# EasyEDA Pro project ProPrj_小车底盘_2026-10-30.epro, board PCB1
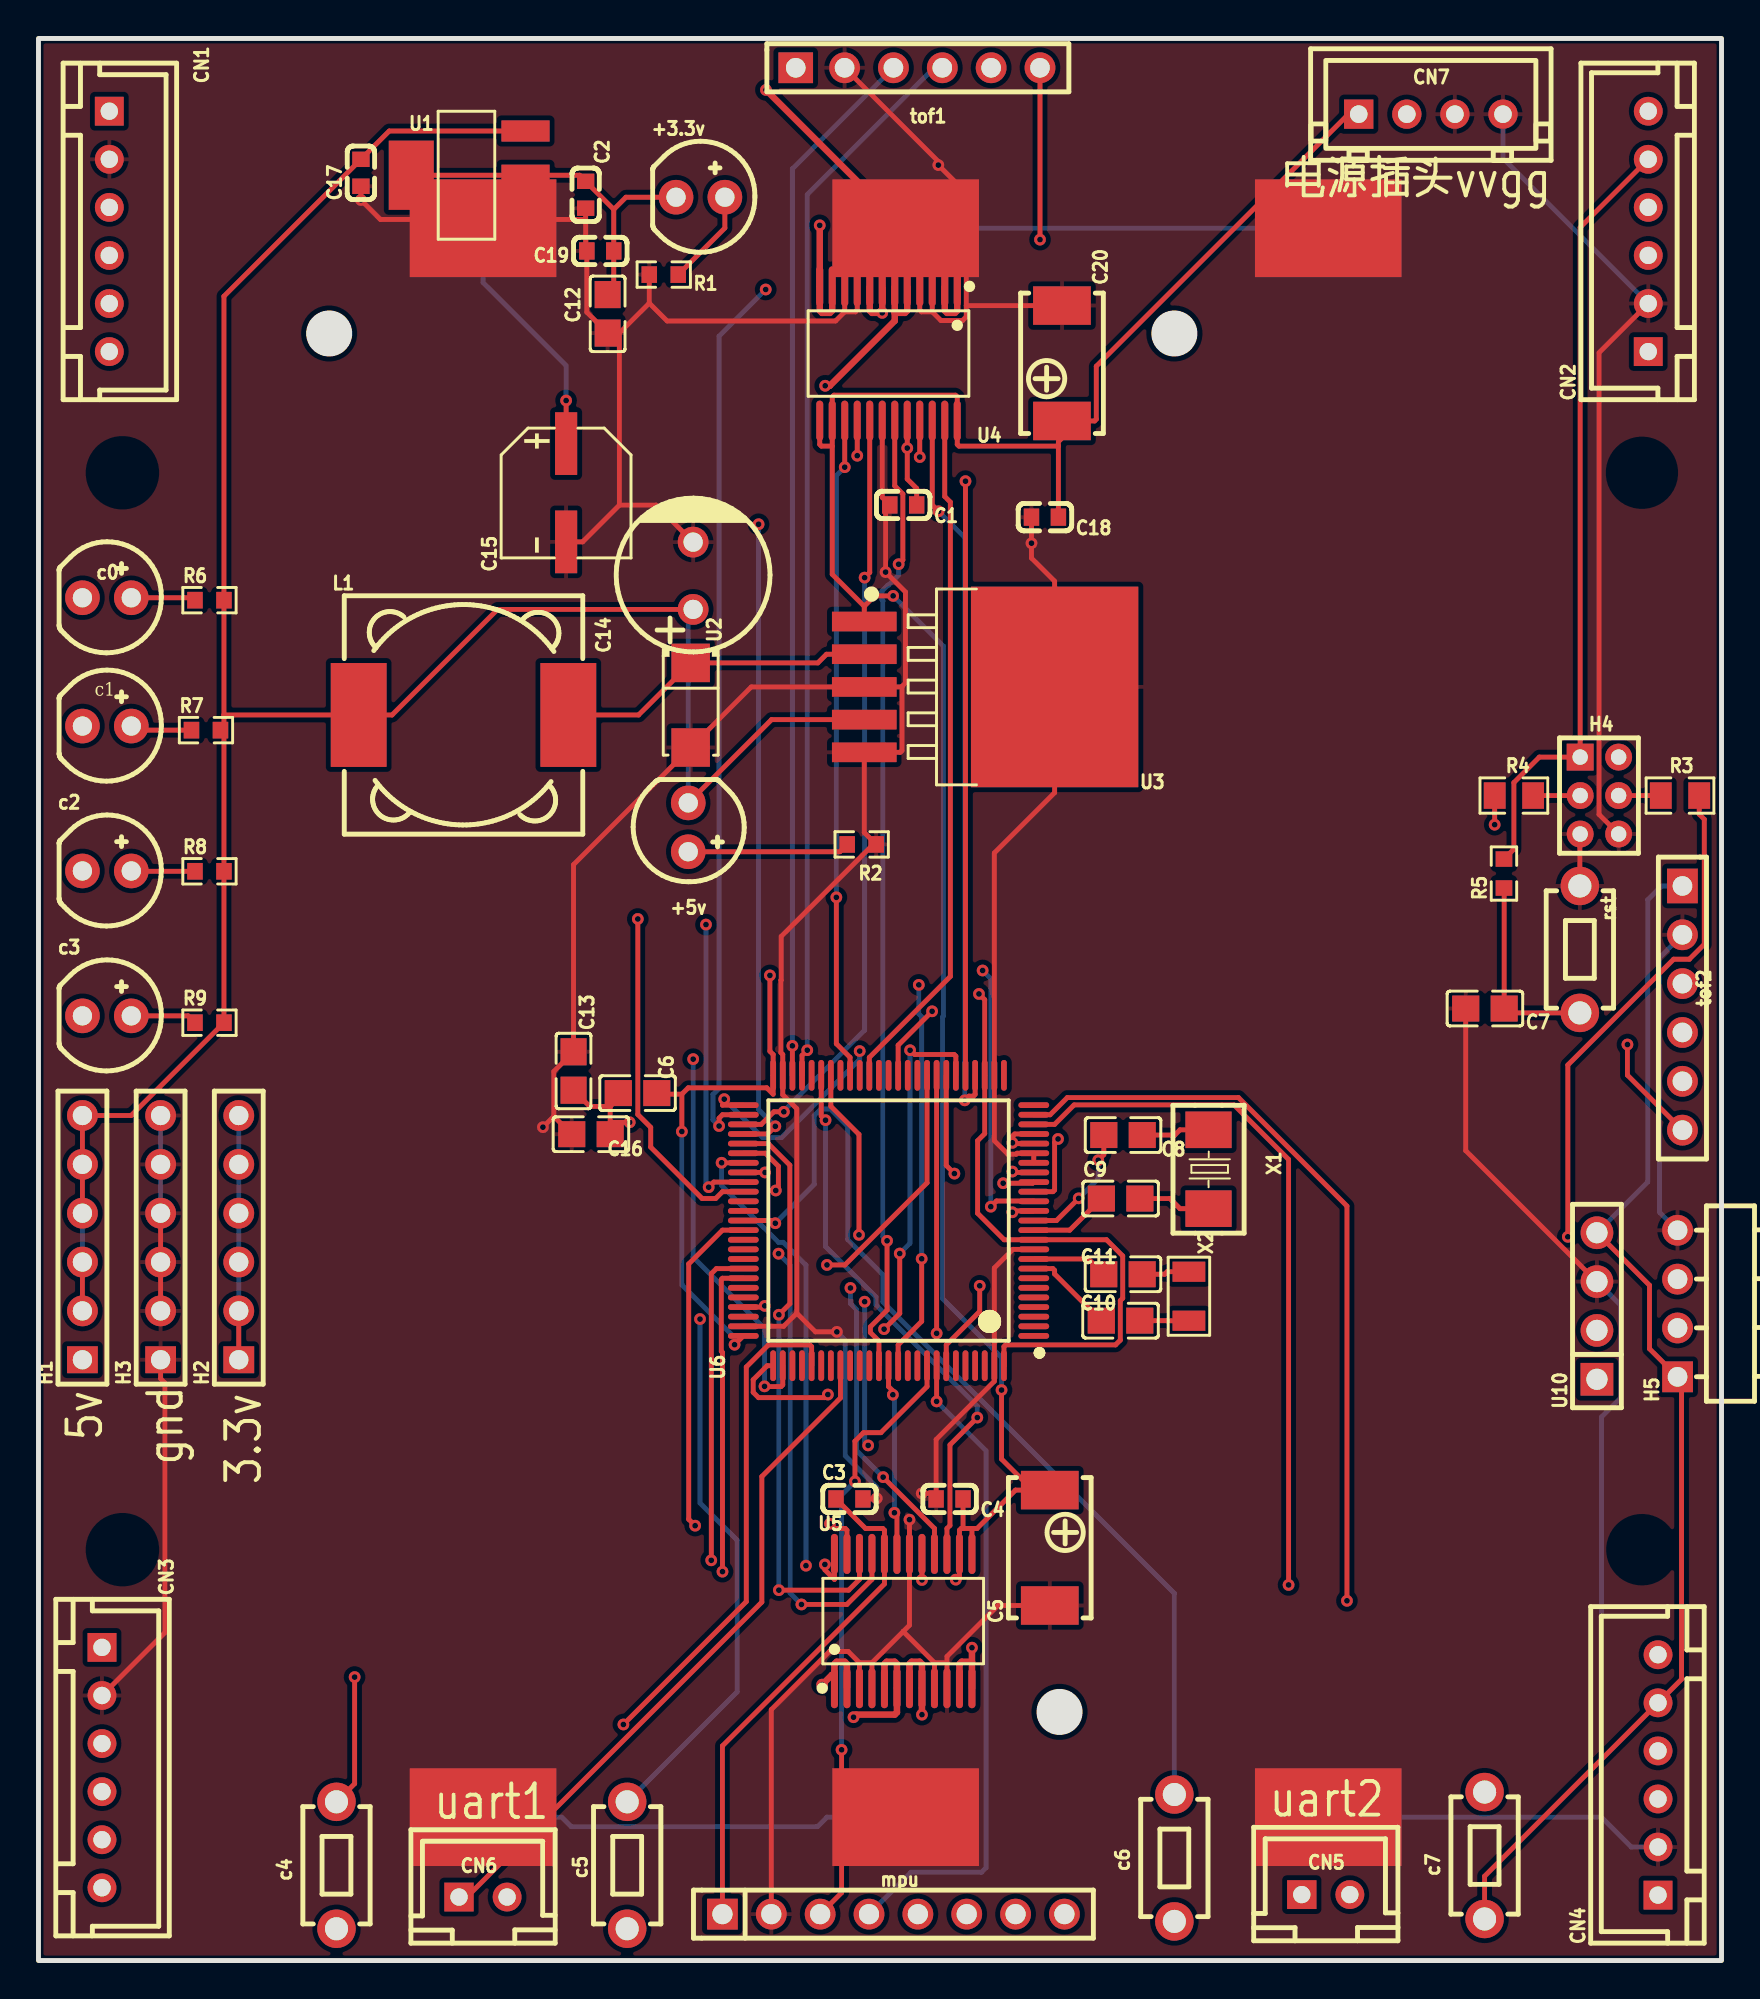
[diagram p1: board, top side]
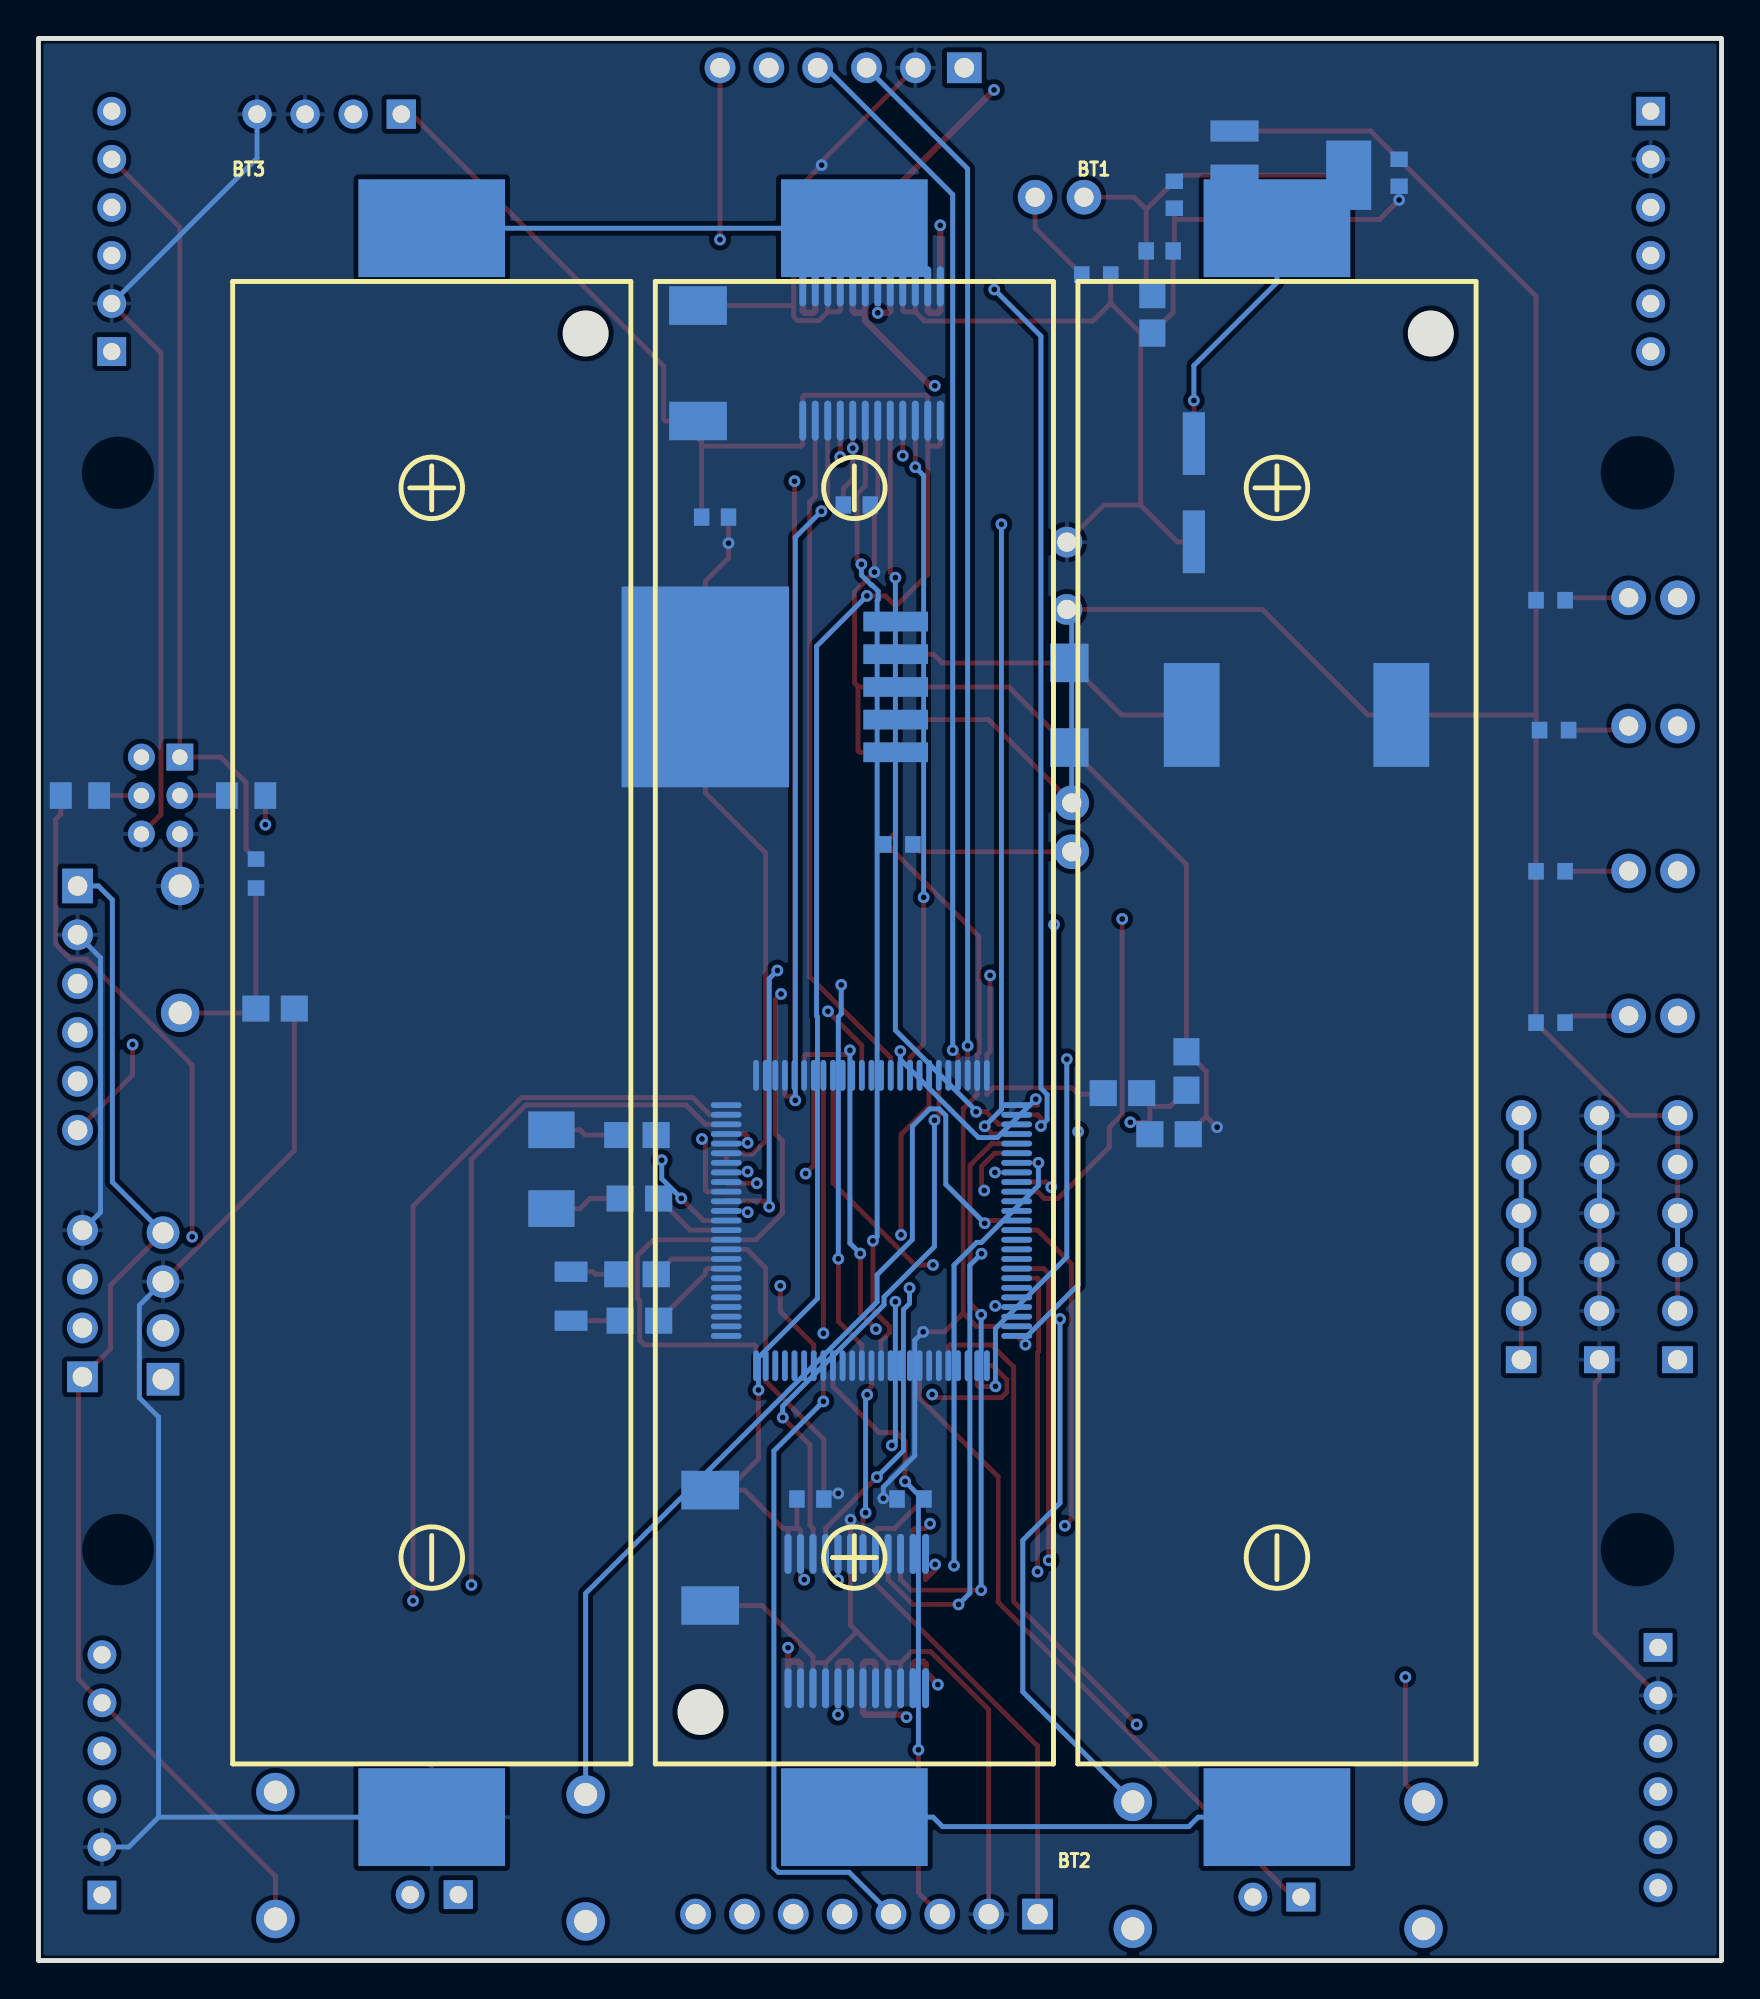
[diagram p2: board, bottom side, seen from below]

Outline 87.5 x 99.95 mm; copper layers: Top Layer, Inner1, Inner2, Bottom Layer. Coordinates in mm from the lower left corner of the outline.
Outline path: rectangle 0,99.95 87.5,0
Stack: Top Layer 0.035mm Outer layer thickness 1oz / Dielectric1 0.2104mm 7628 RC49% 8.6mil er 4.4 / Inner1 0.0152mm Inner layer thickness / Dielectric2 1.065mm 1.1mm H/HOZ Copper er 4.43 / Inner2 0.0152mm Inner layer thickness / Dielectric3 0.2104mm 7628 RC49% 8.6mil er 4.4 / Bottom Layer 0.035mm Outer layer thickness 1oz

## Design rules (mm)
spacing copperThickness1oz (default): track to track 0.102, other pairs 0.152 to 0.3
spacing copperThickness2oz: track to track 0.203, other pairs 0.152 to 0.3
track width copperThickness1oz (default): min 0.127, default 0.254, max 2.54
track width copperThickness2oz: min 0.203, default 0.254, max 2.54
track width power: min 0.2, default 0.5, max 2.54
differential pair differentialPair (default): width min 0.127, default 0.254, max 2.54; gap min 0.152, default 0.152
net GND uses copperRegion
net M1- uses power
net M1+ uses power
net M2- uses copperRegion, power
net M2+ uses power
net M3- uses power
net M3+ uses power
net M4- uses power
net M4+ uses power

## Placement (name value [footprint] x y rotation side)
+3.3v  XL-502UWC  [LED-TH_BD5.9-P2.54-RD_WHITE]  34.42 91.69 0 top
+5v  XL-502UWC  [LED-TH_BD5.9-P2.54-RD_WHITE]  33.78 58.93 270 top
BT1  BH-18650-B1BA002  [BATTERY-SMD_18650-1S-L77.1-W20.7-1]  23.11 48.77 180 bottom
BT2  BH-18650-B1BA002  [BATTERY-SMD_18650-1S-L77.1-W20.7-1]  45.08 48.77 0 bottom
BT3  BH-18650-B1BA002  [BATTERY-SMD_18650-1S-L77.1-W20.7-1]  67.06 48.77 180 bottom
c0  XL-502UWC  [LED-TH_BD5.9-P2.54-RD_WHITE]  3.56 70.87 0 top
C1  100nF  [C0603]  44.96 75.69 180 top
c1  XL-502UWC  [LED-TH_BD5.9-P2.54-RD_WHITE]  3.56 64.19 0 top
C2  22uf  [C0603]  28.45 91.82 270 top
c2  XL-502UWC  [LED-TH_BD5.9-P2.54-RD_WHITE]  3.56 56.66 0 top
C3  100nF  [C0603]  42.16 24 0 top
c3  XL-502UWC  [LED-TH_BD5.9-P2.54-RD_WHITE]  3.56 49.12 0 top
c4  TS1101DH-3x6x5.0-260  [SW-TH_L6.1-W3.5-P6.60-LS8.0]  15.49 4.95 90 top
C4  100nF  [C0603]  47.37 24 180 top
c5  TS1101DH-3x6x5.0-260  [SW-TH_L6.1-W3.5-P6.60-LS8.0]  30.61 4.95 90 top
C5  10uF  [CAP-SMD_L7.3-W4.3-RD_177EC0013]  52.58 21.46 90 top
c6  TS1101DH-3x6x5.0-260  [SW-TH_L6.1-W3.5-P6.60-LS8.0]  59.05 5.33 90 top
C6  100nF  [C0805]  31.15 45.11 0 top
c7  TS1101DH-3x6x5.0-260  [SW-TH_L6.1-W3.5-P6.60-LS8.0]  75.18 5.46 90 top
C7  100nF  [C0805]  75.2 49.5 180 top
C8  20pF  [C0805]  56.39 42.93 180 top
C9  20pF  [C0805]  56.26 39.62 0 top
C10  10pF  [C0805]  56.26 33.27 180 top
C11  10pF  [C0805]  56.38 35.69 180 top
C12  100nF  [C0805]  29.59 85.63 90 top
C13  100nF  [C0805]  27.82 46.26 270 top
C14  220uF  [CAP-TH_BD8.0-P3.50-D0.6-FD]  34.04 72.01 90 top
C15  100uF  [CAP-SMD_BD6.3-L6.6-W6.6-RD]  27.43 76.33 90 top
C16  100nF  [C0805]  28.72 42.97 0 top
C17  10uf  [C0603]  16.76 92.96 90 top
C18  100nF  [C0603]  52.33 75.06 180 top
C19  22uF  [C0603]  29.21 88.9 0 top
C20  10uF  [CAP-SMD_L7.3-W4.3-RD_177EC0013]  53.21 83.06 270 top
CN1  LAIL-PHC2.54-6P-01-XH-L  [CONN-TH_AXH-6A-11]  3.68 89.92 270 top
CN2  LAIL-PHC2.54-6P-01-XH-L  [CONN-TH_AXH-6A-11]  83.69 89.92 90 top
CN3  LAIL-PHC2.54-6P-01-XH-L  [CONN-TH_AXH-6A-11]  3.3 10.03 270 top
CN4  LAIL-PHC2.54-6P-01-XH-L  [CONN-TH_AXH-6A-11]  84.2 9.65 90 top
CN5  LAIL-PHC2.54-2P-01-XH-L  [CONN-TH_2P-P2.50_HC-XH-2A-G]  66.93 3.43 0 top
CN6  LAIL-PHC2.54-2P-01-XH-L  [CONN-TH_2P-P2.50_HC-XH-2A-G]  23.11 3.3 0 top
CN7  LAIL-PHC2.54-4P-01-XH-L  [CONN-TH_LAIL-PHC2.54-4P-01-XH-L]  72.39 96.01 0 top
H1  LAIL-PZ2.54-6P-L  [CONN-TH_LAIL-PZ2.54-6P-L]  2.29 37.59 90 top
H2  LAIL-PZ2.54-6P-L  [CONN-TH_LAIL-PZ2.54-6P-L]  10.41 37.59 90 top
H3  LAIL-PZ2.54-6P-L  [CONN-TH_LAIL-PZ2.54-6P-L]  6.35 37.59 90 top
H4  LAIL-PZ2.0-3PX2-L  [CONN-TH_LAIL-PZ2.0-3PX2-L]  81.15 60.58 270 top
H5  LAIL-PZ2.54-4P-W  [HDR-TH_LAIL-PZ2.54-4P-W]  85.22 34.16 90 top
L1  47uH  [IND-SMD_L12.3-W12.3]  22.1 64.77 0 top
mpu  LAIL-PM2.54-8P-L  [HDR-TH_LAIL-PM2.54-8P-L]  44.45 2.41 0 top
R1  30K  [R0603]  32.51 87.67 180 top
R2  30K  [R0603]  42.8 58.04 0 top
R3  10kΩ  [R0805]  85.34 60.58 0 top
R4  10kΩ  [R0805]  76.71 60.58 0 top
R5  10kΩ  [R0603]  76.19 56.52 90 top
R6  10K  [R0603]  8.89 70.74 0 top
R7  10K  [R0603]  8.71 63.98 0 top
R8  10K  [R0603]  8.89 56.64 0 top
R9  10K  [R0603]  8.89 48.77 0 top
rst  TS1101DH-3x6x5.0-260  [SW-TH_L6.1-W3.5-P6.60-LS8.0]  80.14 52.58 270 top
tof1  LAIL-PM2.54-6P-L  [HDR-TH_LAIL-PM2.54-6P-L]  45.72 98.43 0 top
tof2  LAIL-PM2.54-6P-L  [HDR-TH_LAIL-PM2.54-6P-L]  85.47 49.53 270 top
U1  AMS1117-3.3  [SOT-223-3_L6.5-W3.4-P2.30-LS7.0-BR]  22.35 92.84 0 top
U2  1N5822D_SMA  [SMA_L4.3-W2.6-LS5.2-RD]  33.91 65.28 270 top
U3  LM2596S-5.0/TR  [TO-263-5_L10.1-W8.7-P1.70-LS14.4-BR]  47.88 66.23 180 top
U4  TB6612FNG(O,C,8,EL  [SSOP-24_L8.4-W5.8-P0.65-LS7.8-BL]  44.19 83.57 180 top
U5  TB6612FNG(O,C,8,EL  [SSOP-24_L8.4-W5.8-P0.65-LS7.8-BL]  44.96 17.65 0 top
U6  STM32F103VET6  [LQFP-100_L14.0-W14.0-P0.50-LS16.0-BL]  44.2 38.48 90 top
U10  LAIL-PM2.54-4P-L  [HDR-TH_4P-P2.54-V-F]  81.03 34.04 90 top
X1  8MHz  [CRYSTAL-SMD_L5.0-W3.2]  60.83 41.15 90 top
X2  32.768kHz  [CRYSTAL-SMD_L3.2-W1.5-1]  59.81 34.54 270 top

## Footprints (pads in the part's own frame, mm; a bottom-side part is the same pattern mirrored in y, then rotated)
BATTERY-SMD_18650-1S-L77.1-W20.7-1
  rect 7.62x5.08 hole 0.001: 1(0,-41.313) 2(0,41.313)
C0603
  rect 0.8x0.9 hole 0.001: 1(-0.7,0) 2(0.7,0)
C0805
  rect 1.41x1.35 hole 0.001: 1(-1,0) 2(1,0)
CAP-SMD_BD6.3-L6.6-W6.6-RD
  rect 3.26x1.15 hole 0.001: 1(2.555,0) 2(-2.555,0)
CAP-SMD_L7.3-W4.3-RD_177EC0013
  rect 2x3 hole 0.001: 1(-3,0) 2(3,0)
CAP-TH_BD8.0-P3.50-D0.6-FD
  round 1.6 hole 1: 1(-1.75,0) 2(1.75,0)
CONN-TH_2P-P2.50_HC-XH-2A-G
  rect 1.524x1.5 hole 0.9: 1(-1.25,0)
  round 1.5 hole 0.9: 2(1.25,0)
CONN-TH_AXH-6A-11
  rect 1.5x1.5 hole 0.9: 1(-6.25,0)
  round 1.5 hole 0.9: 2(-3.75,0) 3(-1.25,0) 4(1.25,0) 5(3.75,0) 6(6.25,0)
CONN-TH_LAIL-PHC2.54-4P-01-XH-L
  rect 1.524x1.524 hole 0.914: 1(-3.75,0)
  round 1.524 hole 0.914: 2(-1.25,0) 3(1.25,0) 4(3.75,0)
CONN-TH_LAIL-PZ2.0-3PX2-L
  rect 1.4x1.4 hole 0.8: 1(-2,-1)
  round 1.4 hole 0.8: 2(-2,1) 3(0,-1) 4(0,1) 5(2,-1) 6(2,1)
CONN-TH_LAIL-PZ2.54-6P-L
  rect 1.4x1.6 hole 1: 1(-6.35,0)
  round 1.6 hole 1: 2(-3.81,0) 3(-1.27,0) 4(1.27,0) 5(3.81,0) 6(6.35,0)
CRYSTAL-SMD_L3.2-W1.5-1
  rect 1.05x1.7 hole 0.001: 1(-1.275,0) 2(1.275,0)
CRYSTAL-SMD_L5.0-W3.2
  rect 1.9x2.4 hole 0.001: 1(-2.05,0) 2(2.05,0)
HDR-TH_4P-P2.54-V-F
  rect 1.7x1.7 hole 1.1: 1(-3.81,0)
  round 1.7 hole 1.1: 2(-1.27,0) 3(1.27,0) 4(3.81,0)
HDR-TH_LAIL-PM2.54-6P-L
  rect 1.8x1.6 hole 1.02: 1(-6.35,0)
  round 1.6 hole 1.02: 2(-3.81,0) 3(-1.27,0) 4(1.27,0) 5(3.81,0) 6(6.35,0)
HDR-TH_LAIL-PM2.54-8P-L
  rect 1.6x1.6 hole 1.05: 1(-8.89,0)
  round 1.6 hole 1.05: 2(-6.35,0) 3(-3.81,0) 4(-1.27,0) 5(1.27,0) 6(3.81,0) 7(6.35,0) 8(8.89,0)
HDR-TH_LAIL-PZ2.54-4P-W
  rect 1.6x1.6 hole 1.02: 1(-3.81,0)
  round 1.6 hole 1.02: 2(-1.27,0) 3(1.27,0) 4(3.81,0)
IND-SMD_L12.3-W12.3
  rect 2.9x5.4 hole 0.001: 1(-5.45,0) 2(5.45,0)
LED-TH_BD5.9-P2.54-RD_WHITE
  round 1.8 hole 1: 1(-1.27,0) 2(1.27,0)
LQFP-100_L14.0-W14.0-P0.50-LS16.0-BL
  oval 0.3x1.6 hole 0.001: 1(-6,-7.55) 2(-5.5,-7.55) 3(-5,-7.55) 4(-4.5,-7.55) 5(-4,-7.55) 6(-3.5,-7.55) 7(-3,-7.55) 8(-2.5,-7.55) 9(-2,-7.55) 10(-1.5,-7.55) 11(-1,-7.55) 12(-0.5,-7.55) 13(0,-7.55) 14(0.5,-7.55) 15(1,-7.55) 16(1.5,-7.55) 17(2,-7.55) 18(2.5,-7.55) 19(3,-7.55) 20(3.5,-7.55) 21(4,-7.55) 22(4.5,-7.55) 23(5,-7.55) 24(5.5,-7.55) 25(6,-7.55) 51(6,7.55) 52(5.5,7.55) 53(5,7.55) 54(4.5,7.55) 55(4,7.55) 56(3.5,7.55) 57(3,7.55) 58(2.5,7.55) 59(2,7.55) 60(1.5,7.55) 61(1,7.55) 62(0.5,7.55) 63(0,7.55) 64(-0.5,7.55) 65(-1,7.55) 66(-1.5,7.55) 67(-2,7.55) 68(-2.5,7.55) 69(-3,7.55) 70(-3.5,7.55) 71(-4,7.55) 72(-4.5,7.55) 73(-5,7.55) 74(-5.5,7.55) 75(-6,7.55)
  oval 1.6x0.3 hole 0.001: 26(7.55,-6) 27(7.55,-5.5) 28(7.55,-5) 29(7.55,-4.5) 30(7.55,-4) 31(7.55,-3.5) 32(7.55,-3) 33(7.55,-2.5) 34(7.55,-2) 35(7.55,-1.5) 36(7.55,-1) 37(7.55,-0.5) 38(7.55,0) 39(7.55,0.5) 40(7.55,1) 41(7.55,1.5) 42(7.55,2) 43(7.55,2.5) 44(7.55,3) 45(7.55,3.5) 46(7.55,4) 47(7.55,4.5) 48(7.55,5) 49(7.55,5.5) 50(7.55,6) 76(-7.55,6) 77(-7.55,5.5) 78(-7.55,5) 79(-7.55,4.5) 80(-7.55,4) 81(-7.55,3.5) 82(-7.55,3) 83(-7.55,2.5) 84(-7.55,2) 85(-7.55,1.5) 86(-7.55,1) 87(-7.55,0.5) 88(-7.55,0) 89(-7.55,-0.5) 90(-7.55,-1) 91(-7.55,-1.5) 92(-7.55,-2) 93(-7.55,-2.5) 94(-7.55,-3) 95(-7.55,-3.5) 96(-7.55,-4) 97(-7.55,-4.5) 98(-7.55,-5) 99(-7.55,-5.5) 100(-7.55,-6)
R0603
  rect 0.806x0.864 hole 0.001: 1(-0.753,0) 2(0.753,0)
R0805
  rect 1.133x1.377 hole 0.001: 1(-1,0) 2(1,0)
SMA_L4.3-W2.6-LS5.2-RD
  rect 2x2 hole 0.001: 1(-2.2,0) 2(2.2,0)
SOT-223-3_L6.5-W3.4-P2.30-LS7.0-BR
  rect 2.5x1.1 hole 0.001: 1(2.97,-2.3) 2(2.97,0) 3(2.97,2.3)
  rect 2.34x3.6 hole 0.001: 4(-2.97,0)
SSOP-24_L8.4-W5.8-P0.65-LS7.8-BL
  oval 0.364x2.082 hole 0.001: 1(-3.575,-3.491) 2(-2.925,-3.491) 3(-2.275,-3.491) 4(-1.625,-3.491) 5(-0.975,-3.491) 6(-0.325,-3.491) 7(0.325,-3.491) 8(0.975,-3.491) 9(1.625,-3.491) 10(2.275,-3.491) 11(2.925,-3.491) 12(3.575,-3.491) 13(3.575,3.491) 14(2.925,3.491) 15(2.275,3.491) 16(1.625,3.491) 17(0.975,3.491) 18(0.325,3.491) 19(-0.325,3.491) 20(-0.975,3.491) 21(-1.625,3.491) 22(-2.275,3.491) 23(-2.925,3.491) 24(-3.575,3.491)
SW-TH_L6.1-W3.5-P6.60-LS8.0
  round 2 hole 1.2: 1(-3.3,0) 2(3.3,0)
TO-263-5_L10.1-W8.7-P1.70-LS14.4-BR
  rect 3.358x1.02 hole 0.001: 1(4.949,-3.4) 2(4.949,-1.7) 3(4.949,0) 4(4.949,1.7) 5(4.949,3.4)
  rect 8.7x10.431 hole 0.001: 6(-4.949,0)

## Nets
As in the schematic, except:
GND: BT3.1 C1.2 C2.2 C3.2 C4.2 C5.1 C7.2 C12.1 C13.1 C14.2 C15.2 C16.1 C17.1 C18.2 C19.1 C20.1 CN1.2 CN2.2 CN3.2 CN4.2 CN7.3 CN7.4 H3.1 H3.2 H3.3 H3.4 H3.5 H3.6 H4.5 H4.6 H5.4 mpu.2 R1.2 R2.2 rst.1 tof1.2 tof2.2 U1.1 U2.2 U3.3 U3.5 U3.6 U4.3 U4.4 U4.9 U4.10 U4.18 U5.3 U5.4 U5.9 U5.10 U5.18 U6.10 U6.19 U6.20 U6.27 U6.49 U6.74 U6.99 U10.3
VCC: BT1.2 C4.1 C5.2 C15.1 C18.1 C20.2 CN7.1 CN7.2 U3.1 U4.13 U4.14 U4.24 U5.13 U5.14 U5.24

Pads without a net: mpu 5 6 8; tof1 5; tof2 5; U6 1 2 3 4 5 7 25 26 35 36 38 39 41 43 46 61 62 65 66 67 70 71 73 78 79 81 82 84 85 86 90 91 95 96 97 98

## Via types
v1: diameter 0.61, hole 0.305, Top Layer to Bottom Layer, 108 vias

## Routing (per net, layer and track width the routed paths; a pad name or vN(x,y) marks a point on that pad's centre or on a via; arc(x,y) is an arc through that point)
+3.3V: length 450.8
  Top Layer w0.254: +3.3v.1 30.55,91.69 29.91,91.06 ; C13.2 28.66,44.41 29.72,44.41 ; 29.72,44.41 29.72,43.59 ; 29.72,44.41 30.15,44.84 30.15,45.11 ; 29.72,43.59 C16.2 ; 29.72,43.59 v1(30.74,43.59) ; 50.66,42.52 50.7,42.48 U6.21 ; 50.66,42.52 v1(50.64,42.52) ; 50.66,42.52 50.66,42.89 50.75,42.98 U6.22 ; 29.91,91.06 C2.1 28.13,92.84 U1.2 U1.4 ; 29.91,91.06 C19.2 29.91,86.95 C12.2 ; c7.1 75.18,4.39 CN4.5 85.42,14.63 85.42,30.15 H5.1 83.76,31.81 83.76,35.11 81.03,37.85 ; mpu.1 35.56,11.16 43.98,19.58 U5.20 43.98,22.38 43.89,22.47 43,22.47 C3.1 ; H2.1 H2.2 ; R5.2 76.71,57.79 76.71,61.26 78.03,62.58 H4.1 80.15,90.13 CN2.5 ; U4.20 v1(45.17,78.65) 45.17,77.04 45.66,76.55 C1.1
  Inner2 w0.254: 48.73,39.43 49.1,39.79 50.4,39.79 51.33,40.72 51.33,41.83 v1(50.64,42.52) ; 48.73,39.43 40.32,39.43 35.76,43.98 31.13,43.98 v1(30.74,43.59) 30.39,43.94 H2.6 ; 48.73,39.43 48.73,39.15 49.66,38.22 80.65,38.22 81.03,37.85 ; CN2.5 84.85,94.82 84.85,96.51 84.02,97.34 39.37,97.34 ; H4.1 H4.2 85.47,59.26 tof2.1 ; CN3.5 2.2,5.18 2.2,3.31 3.86,1.65 c4.1 c5.1 31.37,2.41 mpu.1 36.71,1.27 49.65,1.27 mpu.7 52.03,1.18 58.2,1.18 c6.1 75.06,2.03 c7.1 ; 39.37,97.34 38.79,97.34 +3.3v.1 33.15,90.48 ; 39.37,97.34 tof1.1 ; 33.15,90.48 7.99,90.48 CN1.5 ; 33.15,90.48 33.34,90.48 v1(45.17,78.65)
  Bottom Layer w0.254: H2.6 H2.5 H2.4 H2.2 ; 81.03,37.85 83.66,40.48 83.66,55.16 84.39,55.88 tof2.1
+5V: length 127
  Top Layer w0.254: +5v.1 38.11,64.53 U3.4 ; 9.64,64.77 9.64,64.16 9.46,63.98 9.64,63.8 R8.2 R9.2 4.82,43.94 H1.6 H1.5 H1.4 ; 9.64,64.77 R6.2 9.64,86.54 C17.2 18.24,95.14 U1.3 ; 9.64,64.77 L1.1 18.38,64.77 23.87,70.26 C14.1 ; H1.2 2.29,36.32
  Inner2 w0.254: H1.1 H1.2
  Bottom Layer w0.254: C14.1 33.78,70.01 +5v.1 ; H1.4 2.29,36.32
GND: length 543.4
  Top Layer w0.254: v1(45.28,22.93) U5.18 45.28,17.44 44.96,17.11 ; tof1.2 46.78,93.55 v1(46.78,93.36) 48.24,91.91 48.24,86.06 ; C16.1 26.79,43.9 ; 26.79,43.9 26.79,46.23 C13.1 27.82,56.99 U2.2 37.06,66.23 U3.3 44.87,66.23 ; 26.79,43.9 v1(26.23,43.34) ; CN3.2 6.57,17.06 6.57,30.03 6.35,30.26 H3.1 ; 28.45,90.54 U1.1 17.78,90.54 v1(16.76,91.55) C17.1 ; 28.45,90.54 C2.2 ; 28.45,90.54 28.45,88.96 C19.1 28.51,85.71 C12.1 30.2,84.63 ; C5.1 49.89,18.46 47.23,15.81 47.23,15.49 ; 30.2,84.63 30.2,75.68 ; 30.2,84.63 31.76,86.19 ; 30.2,75.68 32.11,75.68 C14.2 ; 30.2,75.68 28.29,73.77 C15.2 ; 42.68,15.49 42.1,16.07 41.13,16.07 38.1,13.05 mpu.2 ; 42.68,15.49 43.33,15.49 ; 42.68,15.49 U5.3 ; 43.33,15.49 44.96,17.11 ; 43.33,15.49 U5.4 ; 44.96,17.11 46.58,15.49 ; C3.2 43.55,24 v1(43.58,24.04) ; H3.2 H3.4 ; H4.5 80.14,58.56 rst.1 ; 39.42,33.66 38.74,32.98 U6.74 ; 39.42,33.66 40.4,32.69 v1(41.51,32.69) ; 39.42,33.66 39.42,44.3 38.7,45.03 U6.49 38.7,47.11 38.6,47.21 38.6,50.97 38.62,50.98 38.62,53.25 43.4,58.04 R2.2 42.93,58.66 U3.5 44.81,62.83 44.9,62.92 44.9,66.2 44.87,66.23 ; 41.92,85.73 U4.10 41.92,88.29 42.01,88.38 45.73,88.38 45.82,88.29 U4.4 45.82,85.82 45.91,85.73 46.47,85.73 ; 41.92,85.73 41.44,85.26 32.68,85.26 31.76,86.19 ; 41.92,85.73 42.48,85.73 42.57,85.82 U4.9 ; 31.76,86.19 R1.2 ; 44.87,66.23 45.08,66.44 45.08,71.17 v1(44.04,72.2) 44.04,75.48 C1.2 43.87,76.08 U4.18 ; U5.9 46.58,15.49 ; 46.58,15.49 47.23,15.49 ; U6.19 U6.20 50.88,41.98 50.83,41.93 50.39,41.93 49.7,42.63 U6.27 49.7,57.6 52.83,60.73 U3.6 52.83,71.73 51.63,72.93 v1(51.63,73.7) C18.2 ; 48.24,86.06 C20.1 ; 48.24,86.06 48.24,85.48 48.04,85.28 46.92,85.28 46.47,85.73 ; 46.47,85.73 U4.3 ; v1(45.92,24.29) 46.38,24.29 C4.2 46.67,27.1 49.7,30.12 U6.99 49.7,36.01 50.66,36.98 U6.10 ; U5.10 47.23,15.49 ; C7.2 74.2,42.11 81.01,35.31 U10.3 ; CN2.2 81.13,83.61 81.13,59.6 H4.6
  Inner2 w0.254: tof2.2 82.67,53.34 rst.1 ; H4.6 H4.5 ; 44.04,73.7 43.99,73.76 C14.2 ; 44.04,73.7 v1(44.04,72.2) ; 44.04,73.7 v1(51.63,73.7) ; v1(26.23,43.34) 25.7,42.81 7.49,42.81 H3.6 ; 45.28,24.04 45.67,24.04 v1(45.92,24.29) ; 45.28,24.04 v1(43.58,24.04) ; 45.28,24.04 v1(45.28,22.93) ; v1(46.78,93.36) 70.99,93.36 CN7.3 CN7.4 ; U10.3 83.69,37.97 H5.4 ; H3.1 H3.2 ; v1(16.76,91.55) 14.65,93.67 CN1.2
  Bottom Layer w0.254: v1(43.58,24.04) 43.58,24.62 41.94,26.25 41.94,32.26 v1(41.51,32.69) ; U10.3 82.26,34.07 82.26,29.26 81.26,28.26 81.26,7.46 ; CN2.2 76.14,93.72 CN7.4 ; BT3.1 81.26,7.46 ; 81.26,7.46 82.81,5.9 CN4.2 ; H5.4 84.28,38.91 84.28,52.15 tof2.2 ; H3.6 H3.5 H3.4
VCC: length 167.6
  Top Layer w0.254: C20.2 54.11,80.06 ; 54.11,80.06 53.03,78.98 53.03,78.75 ; 54.11,80.06 54.91,80.06 55,80.15 55,82.9 68.11,96.01 CN7.1 ; 53.03,78.75 47.86,78.75 47.77,78.84 U4.24 47.77,81.31 47.68,81.4 41.36,81.4 41.27,81.31 U4.14 41.27,78.75 ; 53.03,78.75 C18.1 ; U4.13 40.62,78.84 40.71,78.75 41.27,78.75 ; U5.24 41.38,19.82 40.89,20.32 v1(40.89,20.6) ; 42.93,70.42 43.47,70.96 v1(44.43,70.96) ; 42.93,70.42 U3.1 ; 42.93,70.42 41.27,72.09 41.27,78.75 ; U5.13 48.53,22.47 ; 48.53,22.47 48.07,22.47 ; 48.53,22.47 48.8,22.47 50.8,24.46 51.69,24.46 ; C5.2 51.69,24.46 ; 51.69,24.46 50.07,26.08 v1(50.07,29.67) ; 48.07,22.47 C4.1 ; 48.07,22.47 47.97,22.47 47.88,22.38 U5.14 47.88,19.91 47.79,19.82 47.7,19.82 v1(47.69,19.81) ; v1(27.43,81.12) 27.43,78.88
  Inner2 w0.254: v1(40.89,20.6) 46.9,20.6 v1(47.69,19.81) ; CN7.1 CN7.2 ; v1(44.43,70.96) 35.3,70.96 27.43,78.83 v1(27.43,81.12)
  Bottom Layer w0.254: v1(50.07,29.67) 50.07,31.36 47,34.43 47,49.07 47.05,49.12 47.05,68.35 v1(44.43,70.96) ; v1(27.43,81.12) 27.43,82.94 23.11,87.26 BT1.2
A1: length 65.8
  Top Layer w0.254: v1(34.84,40.22) 35.11,40.48 U6.59
  Inner2 w0.254: v1(34.7,53.87) 30.96,57.61 28.2,57.61 2.57,83.25 2.57,87.55 CN1.4
  Bottom Layer w0.254: v1(34.84,40.22) 34.7,40.36 v1(34.7,53.87)
A2: length 115.9
  Top Layer w0.254: v1(37.75,29.86) 37.76,29.85 38.61,29.85 38.7,29.94 U6.77
  Inner2 w0.254: CN2.4 85.12,89.73 85.12,82.59 53.43,50.89 47.46,50.89 46.18,52.17 38.14,52.17 37.44,51.47 37.44,50.99 37.78,50.64 38.27,50.64 39.08,51.45 45.88,51.45 46.43,50.91 46.43,50.43 45.95,49.95 38.6,49.95 35.52,46.87 v1(34.04,46.87)
  Bottom Layer w0.254: v1(37.75,29.86) 37.75,32.87 34.04,36.58 v1(34.04,46.87)
A3: length 69.7
  Top Layer w0.254: v1(44.78,36.76) 44.78,33.65 v1(43.96,32.83) ; U6.31 47.7,47.02 47.61,47.11 45.56,47.11 45.31,47.36 v1(45.31,47.34)
  Inner2 w0.254: v1(43.96,32.83) 43.23,32.1 39.48,32.1 38.96,32.62 27.14,32.62 CN3.4
  Bottom Layer w0.254: v1(44.78,36.76) 45.31,37.3 v1(45.31,47.34)
A4: length 59.7
  Top Layer w0.254: U6.23 52.83,43.48 53.84,44.49 62.16,44.49 64.99,41.66 v1(64.99,19.53)
  Inner2 w0.254: v1(64.99,19.53) 75.57,19.53 CN4.4
B1: length 67.9
  Top Layer w0.254: U6.60 35.56,39.98 35.21,39.63 34.5,39.63 31.83,42.3 31.83,43.33 31.16,44 v1(31.16,54.16)
  Inner2 w0.254: v1(31.16,54.16) 30.96,54.16 2.21,82.92 2.21,89.69 CN1.3
B2: length 185.4
  Top Layer w0.254: U6.89 44.7,32.01 45.92,33.24 v1(45.92,36.49)
  Inner2 w0.254: v1(45.77,50.73) 38.87,50.73 38.42,50.28 21.06,50.28 1.1,70.23 1.1,71.36 1.8,72.05 2.78,72.05 3.47,71.36 3.47,70.54 20.77,53.24 55.23,53.24 84.72,82.73 84.72,87.63 CN2.3
  Bottom Layer w0.254: v1(45.77,50.73) 45.77,49.22 45.92,49.07 v1(45.92,36.49)
B3: length 84.9
  Top Layer w0.254: U6.32 47.2,41.34 v1(47.62,40.92)
  Inner2 w0.254: CN3.3 6.46,14.45 6.46,24.8 5.27,26 5.27,44.52 5.77,45.03 35.05,45.03 35.41,45.38 35.9,45.38 36.25,45.03 43.51,45.03 v1(47.62,40.92)
B4: length 60
  Top Layer w0.254: U6.24 52.6,43.98 53.49,44.88 62.39,44.88 68.03,39.23 v1(68.03,18.71)
  Inner2 w0.254: CN4.3 73.9,18.71 v1(68.03,18.71)
BOOT0: length 63
  Top Layer w0.254: U6.94 47.2,32.01 48.94,33.75 v1(48.94,35.09) ; v1(79.51,37.63) 79.51,46.57 85.01,52.07 85.83,52.07 86.61,52.85 86.61,59.34 86.34,59.61 R3.2
  Inner2 w0.254: v1(48.94,35.09) 76.97,35.09 v1(79.51,37.63)
BOOT1: length 38.8
  Top Layer w0.254: v1(46.46,49.36) 44.7,47.6 U6.37 ; v1(75.71,59.07) R4.1
  Inner2 w0.254: v1(75.71,59.07) 63.6,59.07 53.89,49.36 v1(46.46,49.36)
C0: length 69.6
  Top Layer w0.254: U6.15 51.73,39.5 49.81,39.5 v1(49.51,39.2)
  Inner2 w0.254: v1(49.09,51.48) 48.04,52.53 20.62,52.53 c0.1
  Bottom Layer w0.254: v1(49.09,51.48) 49.51,51.06 v1(49.51,39.2)
C1: length 63.6
  Top Layer w0.254: v1(53.01,42.72) 52.83,42.54 52.83,40.07 52.74,39.98 U6.16
  Inner2 w0.254: v1(53.01,42.72) 49.45,46.28 36.53,46.28 36.34,46.46 34.96,46.46 34.78,46.28 20.2,46.28 c1.1
C2: length 63
  Top Layer w0.254: U6.17 51.69,40.42 v1(50.15,40.42)
  Inner2 w0.254: c2.1 0.99,55.36 0.99,48.69 4.29,45.39 34.91,45.39 35.26,45.74 36.05,45.74 36.4,45.39 45.19,45.39 v1(50.15,40.42)
C3: length 53.1
  Top Layer w0.254: U6.18 50.68,40.98 v1(50.63,41.03)
  Inner2 w0.254: c3.1 5.66,45.75 34.76,45.75 35.11,46.1 36.2,46.1 36.55,45.75 45.91,45.75 v1(50.63,41.03)
C4: length 58
  Top Layer w0.254: c4.2 16.44,9.2 v1(16.44,14.74) ; U6.33 v1(46.7,32.62)
  Inner2 w0.254: v1(46.7,32.62) 45.38,31.3 40.8,31.3 24.24,14.74 v1(16.44,14.74)
C5: length 48.6
  Top Layer w0.254: U6.34 46.2,40.44 41.93,36.17 v1(40.99,36.17)
  Inner2 w0.254: v1(40.99,36.17) 37.21,36.17 v1(34.39,33.36)
  Bottom Layer w0.254: c5.2 36.33,13.97 36.33,21.86 34.39,23.79 v1(34.39,33.36)
C6: length 52.2
  Top Layer w0.254: U6.63 38.17,38.48 v1(38.31,38.34)
  Bottom Layer w0.254: c6.2 59.05,19.09 43.9,34.25 43.9,35.66 42.07,37.49 42.07,43.38 41.16,44.29 40.68,44.29 40.33,43.94 40.33,40.36 v1(38.31,38.34)
C7: length 64.8
  Top Layer w0.254: v1(34.14,22.61) 33.81,22.95 33.81,36.22 35.56,37.98 U6.64
  Inner2 w0.254: c7.2 73.48,10.47 47.31,10.47 40.26,17.52 40.26,18.76 36.4,22.61 v1(34.14,22.61)
CLK: length 51.7
  Top Layer w0.254: v1(41.04,29.43) 40.88,29.27 37.44,29.27 37.16,29.55 37.16,30.2 37.89,30.93 U6.76
  Inner2 w0.254: H5.2 83.75,31.42 50.11,31.42 48.7,30.01 41.62,30.01 v1(41.04,29.43)
M1: length 35.9
  Top Layer w0.254: U4.23 47.12,76.13 47.41,75.84 47.41,51.17 43.2,46.96 U6.40
M1+: length 52.8
  Top Layer w0.336: U4.2 47.12,85.8 47.24,85.68 47.65,85.68 47.77,85.8 U4.1 47.77,88.32 47.65,88.43 46.66,88.43 v1(37.82,97.27)
  Inner2 w0.336: v1(37.82,97.27) 4.79,97.27 CN1.1
M1-: length 46.7
  Top Layer w0.336: 44.52,85.68 44.52,85.27 41.14,81.89 v1(40.9,81.89) ; 44.52,85.68 45.05,85.68 45.17,85.8 U4.5 ; 44.52,85.68 U4.6
  Inner2 w0.5: v1(40.9,81.89) 5.46,81.89 CN1.6
M1-1: length 35.7
  Top Layer w0.254: U6.30 v1(48.2,76.93) ; U4.21 v1(45.82,78.18)
  Inner2 w0.254: v1(45.82,78.18) 47.07,76.93 v1(48.2,76.93)
M1-2: length 37.7
  Top Layer w0.254: U4.22 46.47,75.69 v1(46.8,75.36) ; v1(48.16,44.73) 48.37,44.95 48.61,44.95 48.7,45.04 U6.29
  Bottom Layer w0.254: v1(48.16,44.73) 48.16,74 v1(46.8,75.36)
M2: length 34.5
  Top Layer w0.254: v1(41.48,55.29) 41.48,47.68 42.2,46.96 U6.42 ; U4.15 v1(41.92,77.66)
  Bottom Layer w0.254: v1(41.48,55.29) 41.48,77.22 v1(41.92,77.66)
M2+: length 44.6
  Top Layer w0.336: U4.7 v1(43.87,85.68) 43.34,85.68 43.22,85.8 U4.8
  Inner2 w0.336: CN2.1 80.92,86.44 44.62,86.44 v1(43.87,85.68)
M2-: length 52
  Top Layer w0.336: U4.11 41.27,85.8 41.15,85.68 40.74,85.68 40.62,85.8 U4.12 v1(40.62,90.23)
  Inner2 w0.336: v1(40.62,90.23) 77.76,90.23 CN2.6
M2-1: length 40.2
  Top Layer w0.254: v1(42.95,71.91) 43.22,72.18 U4.17 ; v1(38.75,44.14) 38.23,44.14 37.58,43.48 U6.53
  Bottom Layer w0.254: v1(42.95,71.91) 42.95,48.38 38.75,44.18 v1(38.75,44.14)
M2-2: length 41.9
  Top Layer w0.254: U6.54 37.91,42.98 v1(38.31,43.38) ; v1(42.57,78.25) U4.16
  Inner2 w0.254: v1(37.44,74.69) 41,78.25 v1(42.57,78.25)
  Bottom Layer w0.254: v1(38.31,43.38) 37.44,44.25 v1(37.44,74.69)
M3: length 27.2
  Top Layer w0.254: U5.23 42.03,22.38 41.94,22.47 41.4,22.47 v1(41.15,22.72) ; U6.44 41.2,44.42 42.66,42.96 v1(42.66,37.74)
  Inner2 w0.254: v1(43.14,26.79) 43.14,24.7 v1(41.15,22.72) ; v1(42.95,34.26) 42.95,37.44 v1(42.66,37.74)
  Bottom Layer w0.254: v1(42.95,34.26) 42.95,26.97 v1(43.14,26.79)
M3+: length 99.4
  Top Layer w0.336: U5.2 42.03,15.42 41.91,15.54 41.5,15.54 41.38,15.42 41.38,14.85 ; 41.38,14.85 41.25,14.85 v1(40.74,14.35) ; 41.38,14.85 U5.1
  Inner2 w0.336: CN3.1 2.11,15.09 2.11,8.44 3.02,7.53 3.64,7.53 27.05,30.95 39.88,30.95 40.63,31.7 43.81,31.7 45.36,33.24 47.24,33.24 47.43,33.06 47.43,32.43 45.89,30.9 40.96,30.9 33.5,23.44 33.5,21.36 40.52,14.35 v1(40.74,14.35)
M3-: length 49.8
  Top Layer w0.336: v1(42.37,12.65) 42.51,12.79 44.52,12.79 44.63,12.9 U5.6 44.63,15.42 44.52,15.54 44.1,15.54 43.98,15.42 U5.5
  Inner2 w0.336: v1(42.37,12.65) 42.13,12.9 12.42,12.9 CN3.6
M3-1: length 31.4
  Top Layer w0.254: U5.21 43.33,19.82 42.03,18.52 v1(39.67,18.52) ; v1(38.33,40.04) 38.47,40.18 38.47,41.31 37.79,41.98 U6.56
  Inner2 w0.254: v1(38.48,36.76) 38.97,37.25 38.97,39.41 v1(38.33,40.04)
  Bottom Layer w0.254: v1(38.48,36.76) 39.08,36.15 39.08,19.1 v1(39.67,18.52)
M3-2: length 31
  Top Layer w0.254: U6.55 37.94,42.48 39.06,41.36 39.06,34.15 v1(38.49,33.58) ; U5.22 42.68,19.82 42.12,19.26 v1(38.49,19.26)
  Bottom Layer w0.254: v1(38.49,33.58) v1(38.49,19.26)
M4: length 28.9
  Top Layer w0.254: v1(40.92,43.7) 40.7,43.92 U6.45 ; v1(48.81,28.24) 47.39,26.82 47.39,22.62 47.23,22.47 U5.15
  Bottom Layer w0.254: v1(48.81,28.24) 48.81,28.83 43.54,34.1 43.54,34.5 40.92,37.13 v1(40.92,43.7)
M4+: length 46.8
  Top Layer w0.336: v1(45.93,12.79) U5.8 45.93,15.42 45.81,15.54 45.4,15.54 45.28,15.42 U5.7
  Inner2 w0.336: v1(45.93,12.79) 47.53,11.19 76.41,11.19 CN4.1
M4-: length 43.2
  Top Layer w0.336: U5.12 48.53,15.54 ; 48.53,15.54 48,15.54 47.88,15.42 U5.11 ; 48.53,15.54 v1(48.53,16.27)
  Inner2 w0.336: CN4.6 79.78,20.32 52.59,20.32 v1(48.53,16.27)
M4-1: length 31.7
  Top Layer w0.254: U6.57 35.56,41.48 35.56,41.48 v1(35.52,41.48) ; U5.17 v1(45.93,19.79)
  Inner2 w0.254: v1(45.93,19.79) 40.65,19.79 v1(39.9,20.53)
  Bottom Layer w0.254: v1(39.9,20.53) 39.9,36.16 38.72,37.35 38.48,37.35 35.52,40.31 v1(35.52,41.48)
M4-2: length 24.9
  Top Layer w0.254: v1(43.91,25.14) 46.58,22.47 U5.16 ; U6.58 v1(37.78,40.98)
  Inner2 w0.254: v1(42.22,34.97) 42.22,36.99 38.22,40.98 v1(37.78,40.98)
  Bottom Layer w0.254: v1(42.22,34.97) 42.22,34.17 42.53,33.85 42.53,26.52 v1(43.91,25.14)
NRST: length 58.8
  Top Layer w0.254: v1(50.63,38.91) 50.7,38.98 U6.14 ; rst.2 76.43,49.28 C7.1 76.2,55.76 76.19,55.77
  Inner2 w0.254: rst.2 80.22,49.36 85.92,49.36 86.65,48.62 86.65,47.82 86.01,47.17 85.35,47.17 77.09,38.91 v1(50.63,38.91)
OCS32-IN: length 4.7
  Top Layer w0.254: C10.2 52.83,35.7 52.83,35.89 52.74,35.98 U6.8
OCS32-OUT: length 4
  Top Layer w0.254: C11.2 54.59,36.48 U6.9
OCS-IN: length 4.2
  Top Layer w0.254: C9.1 53.62,37.98 U6.12
OCS-OUT: length 6.6
  Top Layer w0.254: v1(54.08,39.64) 52.93,38.48 U6.13 ; v1(55.1,41.62) 55.39,41.91 C8.2
  Bottom Layer w0.254: v1(55.1,41.62) 55.1,40.65 v1(54.08,39.64)
RX0: length 53.5
  Top Layer w0.254: v1(35.56,20.22) 35.56,31.62 35.5,31.68 35.5,35.42 35.56,35.48 U6.69
  Inner2 w0.254: CN5.1 63.77,5.33 50.59,5.33 35.7,20.22 v1(35.56,20.22)
RX1: length 36.1
  Top Layer w0.254: CN6.1 22.27,3.3 37.61,18.64 37.61,25.17 41.7,29.26 U6.83
SCL-MPU: length 78.8
  Top Layer w0.254: v1(42.45,24.91) 42.45,27.01 42.89,27.45 43.8,27.45 46.2,29.85 U6.92 ; mpu.3 41.75,3.53 v1(41.75,10.96)
  Inner2 w0.254: 81.03,32.77 48.59,32.77 46.19,30.37 41.13,30.37 40.43,29.67 40.43,26.93 v1(42.45,24.91)
  Bottom Layer w0.254: v1(42.45,24.91) 41.75,24.22 v1(41.75,10.96)
SCL-TOF: length 102.1
  Top Layer w0.254: v1(39.97,47.34) 39.7,47.07 U6.47
  Inner2 w0.254: tof2.4 83.9,46.69 40.62,46.69 v1(39.97,47.34)
  Bottom Layer w0.254: tof1.4 46.57,98.43 39.97,91.83 v1(39.97,47.34)
SDA-MPU: length 69.1
  Top Layer w0.254: U6.93 v1(46.7,29.08)
  Inner2 w0.254: 81.03,30.23 79.87,29.08 v1(46.7,29.08)
  Bottom Layer w0.254: mpu.4 45.36,4.59 49.03,4.59 49.27,4.83 49.27,26.5 v1(46.7,29.08)
SDA-TOF: length 102.2
  Top Layer w0.254: v1(39.2,47.56) U6.48
  Inner2 w0.254: v1(39.2,47.56) 40.4,48.77 65.42,48.77 67.45,50.8 tof2.3
  Bottom Layer w0.254: v1(39.2,47.56) 39.2,93.17 tof1.3
SET-X: length 57.4
  Top Layer w0.254: U6.51 35.56,44.48 35.65,44.57 v1(35.65,44.79) ; v1(82.61,47.63) 82.61,46.04 tof2.6
  Inner2 w0.254: v1(42.7,47.29) 43.33,47.92 82.32,47.92 v1(82.61,47.63)
  Bottom Layer w0.254: v1(35.65,44.79) 37.65,42.8 38.63,42.8 42.7,46.86 v1(42.7,47.29)
SET-Y: length 70.8
  Top Layer w0.254: U6.52 35.56,43.98 35.38,43.8 v1(35.38,43.4) ; tof1.6 v1(52.07,89.49)
  Inner2 w0.254: v1(52.07,89.49) 49.48,86.9 v1(37.81,86.9)
  Bottom Layer w0.254: v1(37.81,86.9) 35.38,84.47 35.38,45.36 35.06,45.04 35.06,43.71 v1(35.38,43.4)
STBY-1: length 50.4
  Top Layer w0.254: v1(44.12,37.43) 44.12,33.82 43.25,32.95 43.25,32.66 43.7,32.21 U6.87 ; U4.19 44.52,76.68 44.94,76.26 44.94,72.83 v1(44.72,72.61)
  Bottom Layer w0.254: v1(44.72,72.61) 44.72,72.05 44.19,71.52 44.15,71.52 43.85,71.21 43.85,70.77 43.9,70.72 43.9,37.65 v1(44.12,37.43)
STBY-2: length 10
  Top Layer w0.254: v1(44.42,29.42) 44.42,29.62 44.2,29.85 U6.88 ; U5.19 44.63,23.15 v1(44.5,23.28)
  Bottom Layer w0.254: v1(44.5,23.28) 44.5,29.34 v1(44.42,29.42)
SWIO: length 49.6
  Top Layer w0.254: v1(37.76,34.04) 37.7,33.98 U6.72
  Inner2 w0.254: H5.3 83.95,34.16 43.69,34.16 43.2,33.67 39.23,33.67 38.74,34.17 37.89,34.17 v1(37.76,34.04)
TX0: length 57.1
  Top Layer w0.254: U6.68 35.24,35.98 34.98,35.72 34.98,20.82 v1(34.98,20.81)
  Inner2 w0.254: CN5.2 65.58,6.03 50.72,6.03 35.94,20.81 v1(34.98,20.81)
TX1: length 37.6
  Top Layer w0.254: v1(30.41,12.27) 36.8,18.66 36.8,30.86 37.95,32.01 40.11,32.01 40.2,31.93 U6.80
  Inner2 w0.254: v1(30.41,12.27) 24.36,6.23 CN6.2
$1N25: length 22.4
  Bottom Layer w0.254: BT2.2 40.99,7.46 40.5,6.96 27.7,6.96 27.21,7.46 BT1.1
$1N26: length 22
  Bottom Layer w0.254: BT3.2 BT2.1
$1N41: length 16.7
  Top Layer w0.254: U3.2 40.97,67.93 40.52,67.48 U2.1 31.2,64.77 L1.2
$1N46: length 5
  Top Layer w0.254: 33.26,87.67 35.69,90.09 +3.3v.2
$1N47: length 8.4
  Top Layer w0.254: +5v.2 41.66,57.66 R2.1
$1N102: length 70.9
  Top Layer w0.254: v1(38.03,51.23) 38.03,47.28 38.2,47.11 U6.50 38.2,45.05 37.87,45.38 33.78,45.38 33.45,45.05 ; 33.45,45.05 v1(33.45,43.11) ; 33.45,45.05 32.2,45.05 32.15,45.11 ; v1(48.9,50.26) 49.2,49.96 U6.28 49.2,43 48.83,42.63 48.83,38.86 50.2,37.48 U6.11 55.53,37.48 56.37,36.64 56.37,34.44 56.24,34.32 56.24,32.26 56,32.01 50.29,32.01 50.2,31.93 U6.100 ; U6.75 v1(36.19,32.02)
  Inner2 w0.254: v1(48.9,50.26) 47.58,50.26 46.03,51.81 38.61,51.81 v1(38.03,51.23)
  Bottom Layer w0.254: v1(33.45,43.11) 33.45,35.13 36.19,32.39 v1(36.19,32.02)
$1N107: length 2.4
  Top Layer w0.254: H4.3 R4.2
$1N108: length 2.2
  Top Layer w0.254: R3.1 H4.4
$1N153: length 3.6
  Top Layer w0.254: C8.1 59.08,42.93 59.35,43.2 X1.2
$1N154: length 3.8
  Top Layer w0.254: X1.1 59.35,39.1 58.82,39.62 C9.2
$1N159: length 2.6
  Top Layer w0.254: X2.2 58.68,33.27 58.67,33.27 C10.1
$1N160: length 2.5
  Top Layer w0.254: C11.1 58.55,35.69 58.68,35.82 X2.1
$1N223: length 3.4
  Top Layer w0.254: R6.1 8.01,70.87 c0.2
$1N224: length 3.2
  Top Layer w0.254: R7.1 5.04,63.98 c1.2
$1N225: length 3.3
  Top Layer w0.254: R8.1 4.84,56.64 c2.2
$1N226: length 3.5
  Top Layer w0.254: R9.1 7.78,49.12 c3.2

## Copper pours and planes (outline as drawn; the poured copper is in the pictures)
GND on Top Layer: -3.81,104.14 90.93,104.14 90.93,-3.56 -3.81,-3.56
GND on Bottom Layer: -14.1,106.3 107.7,106.3 107.7,-8 -14.1,-8

## Text on the board
Top Silkscreen Layer: uart1 | uart2 | 5v | gnd | 3.3v | 电源插头vvgg
